# Altium schematic sheet Sensors_Board.SchDoc (part 2 of 2)
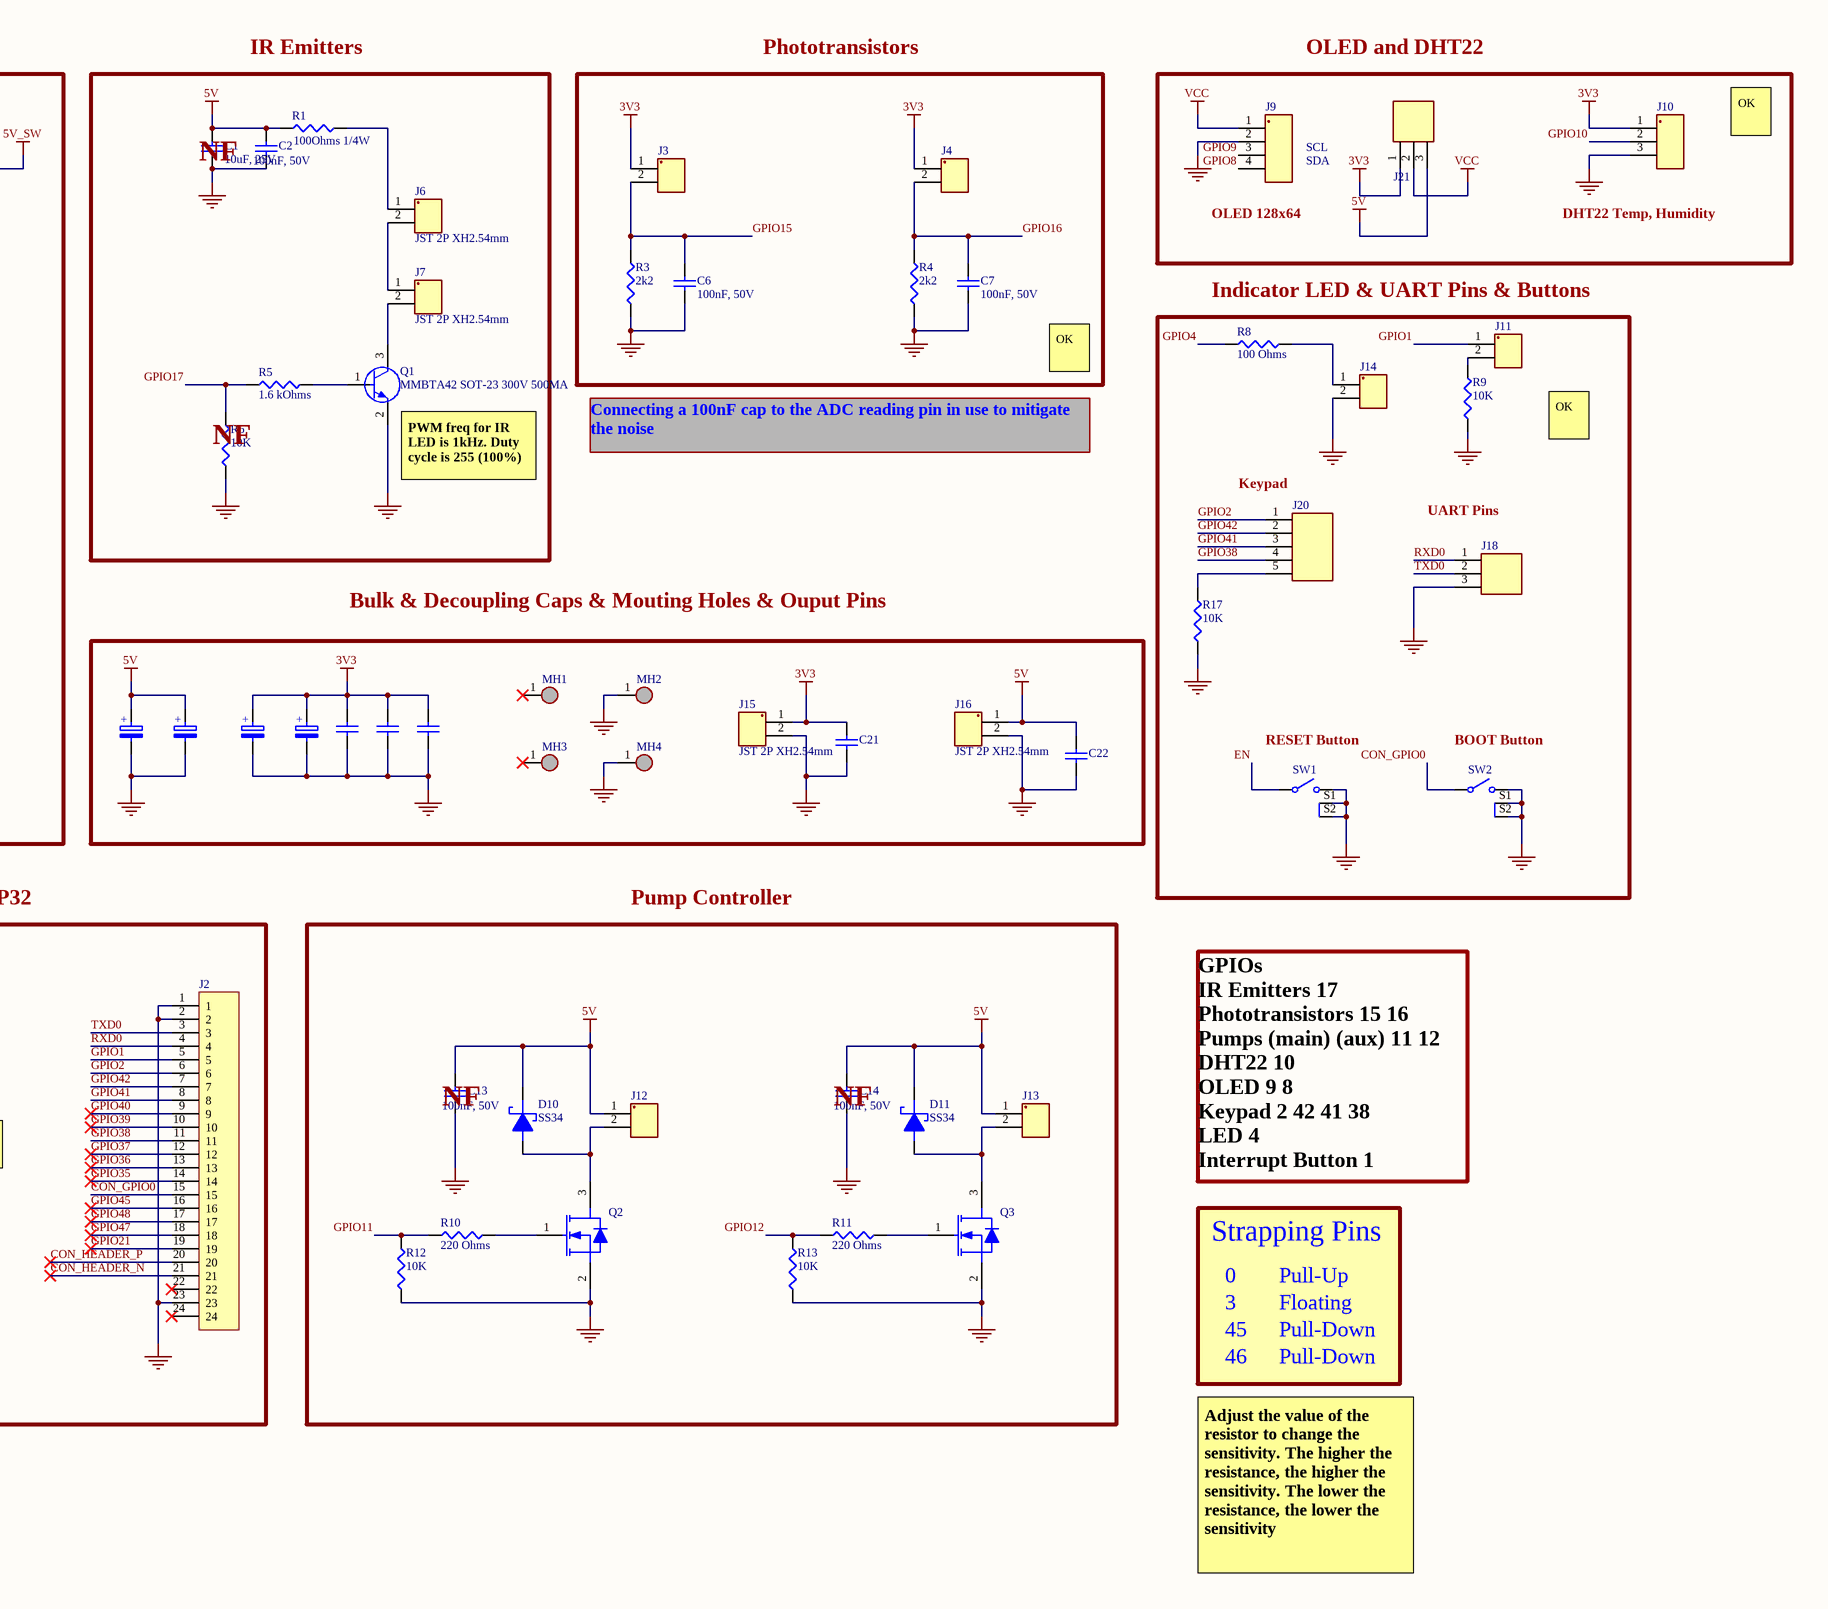
[diagram p2: Sensors_Board.SchDoc, right]

## Library data of the parts
C1 C4 C5 C9 C11 C25 = CL21B106KAYQNNE: 25V 10uF X7R ±10% 0805 Multilayer Ceramic Capacitors MLCC - SMD/SMT ROHS; Manufacturer: Samsung; Multilayer: Yes; Supplier: Digikey; Supplier Part Number: 1276-CL21B106KAYQNNECT-ND; Manufacturer Part Number: CL21B106KAYQNNE; RoHS: Yes; Category: Ceramic Capacitors; Pricing: 1=0.35, 10=0.206, 50=0.1484, 100=0.1304, 500=0.09992, 1000=0.09042 (USD); Mounting Technology: Surface Mount; Pins: 2; Dielectric Material: Ceramic; Package Shape: Rectangular; Case/Package: 0805; Min Operating Temperature: -55°C; Max Operating Temperature: 125°C; Value: 10uF; Capacitor Type: Ceramic; Tolerance  (fill in as +-): 10%; Packaging: Tape and Reel; Tolerance (fill in as +-): 10%; Rated DC Voltage (URdc): 25V; Temperature Characteristics Code: X7R; Termination: Wraparound; Reach SVHC Compliant: Yes; RoHS Compliant: No; ComponentLink1URL: https://datasheet.ciiva.com:443/pdfs/VipMasterIC/IC/SEMS/SEMS-S-A0005593215/SEMS-S-A0005590463-1.pdf?src-supplier=IHS+Markit; ComponentLink1Description: https://datasheet.ciiva.com:443/pdfs/VipMasterIC/IC/SEMS/SEMS-S-A0005593215/SEMS-S-A0005590463-1.pdf?src-supplier=IHS+Markit; LCSC Part Number: C3039694
C2 C6 C7 C10 C12-C14 C16 C18 C19 C21 C22 C26 = CL21B104KBCNNNC: 50V 100nF X7R ±10% 0805 Multilayer Ceramic Capacitors MLCC - SMD/SMT ROHS; Manufacturer: Samsung; Multilayer: Yes; Supplier: Digikey; Supplier Part Number: 1276-1003-6-ND; Manufacturer Part Number: CL21B104KBCNNNC; RoHS: Yes; Category: Ceramic Capacitors; Stock: 2034358; Pricing: 1=0.1, 10=0.035, 50=0.0238, 100=0.0203, 500=0.01446, 1000=0.01266 (USD); Mounting Technology: Surface Mount; Pins: 2; Dielectric Material: Ceramic; Package Shape: Rectangular; Case/Package: 0805; Terminal Finish: Nickel; Min Operating Temperature: -55°C; Max Operating Temperature: 125°C; JESD-609 Code: e3; Value: 100nF; Capacitor Type: Ceramic; Tolerance  (fill in as +-): 10%; Package Style: SMTMeter; Packaging: Tape and Reel; Tolerance (fill in as +-): 10%; Rated DC Voltage (URdc): 50V; Temperature Characteristics Code: X7R; Termination: Wraparound; Length: 2mm; Width: 1.25mm; Height: 0.95mm; Reach SVHC Compliant: Yes; RoHS Compliant: Yes; LCSC Part Number: C1711
C3 = CC0805KKX7RYBB103: 250V 10nF X7R ±10% 0805 Multilayer Ceramic Capacitors MLCC - SMD/SMT ROHS; Datasheet: https://www.lcsc.com/datasheet/lcsc_datasheet_2304140030_YAGEO-CC0805KKX7RYBB103_C106841.pdf; LCSC Number Part: C106841
C15 = 25SVPF100M: 100 µF 25 V Aluminum - Polymer Capacitors Radial, Can - SMD 24mOhm 5000 Hrs @ 105°C; Manufacturer: Panasonic; Dielectric Material: Aluminium; Polarity: Polarized; ESR (Equivalent Series Resistance): 24mR; Leakage Current: 500uA; Tolerance  (fill in as +-): 20%; Ripple Current: 160mA; Tan Delta: 0.12; Supplier: Digikey; Supplier Part Number: P123675DKR-ND; Manufacturer Part Number: 25SVPF100M; RoHS: Yes; Category: Polymer Capacitors; Stock: 6667; Pricing: 1=1.26, 10=0.813, 50=0.7876, 100=0.762, 500=0.608 (USD); Mounting Technology: Surface Mount; Pins: 2; Package Shape: Cylindrical; Case/Package: 3333; Min Operating Temperature: -55°C; Max Operating Temperature: 105°C; Value: 100uF; Capacitor Type: Aluminium; Tolerance (fill in as +-): 20%; Rated DC Voltage (URdc): 25V; Termination: Flat; Reach SVHC Compliant: Yes; RoHS Compliant: Yes; ComponentLink1URL: https://datasheet.ciiva.com:443/pdfs/VipMasterIC/IC/PANA/PANA-S-A0008969958/PANA-S-A0008969958-1.pdf?src-supplier=IHS+Markit; ComponentLink1Description: https://datasheet.ciiva.com:443/pdfs/VipMasterIC/IC/PANA/PANA-S-A0008969958/PANA-S-A0008969958-1.pdf?src-supplier=IHS+Markit; ComponentLink2URL: https://datasheet.ciiva.com/25746/1734360-25746518.pdf?src-supplier=Farnell; ComponentLink2Description: https://datasheet.ciiva.com/25746/1734360-25746518.pdf?src-supplier=Farnell; ComponentLink3URL: https://datasheet.ciiva.com/22746/1734360-22746213.pdf?src-supplier=Element14; ComponentLink3Description: https://datasheet.ciiva.com/22746/1734360-22746213.pdf?src-supplier=Element14; LCSC Part Number: C4747967
C20 = EEH-ZA1H100R: CAP ALUM HYBRID 10UF 20% 50V SMD (D5L6P10); Manufacturer: Panasonic; Dielectric Material: Aluminium; Polarity: Polarized; ESR (Equivalent Series Resistance): 120mR; Leakage Current: 5uA; Ripple Current: 75mA; Tan Delta: 0.1; Reference Standard: AEC-Q200; Supplier: Digikey; Supplier Part Number: 10-EEH-ZA1H100RCT-ND; Manufacturer Part Number: EEH-ZA1H100R; RoHS: Yes; Category: Polymer Capacitors; Stock: 1272; Pricing: 1=1.36, 10=0.853, 50=0.6486, 100=0.5847, 500=0.47586 (USD); Mounting Technology: Surface Mount; Pins: 2; Case/Package: 2121; Min Operating Temperature: -55°C; Max Operating Temperature: 105°C; Value: 10uF; Capacitor Type: Aluminium; Tolerance  (fill in as +-): 20%; Package Style: SMTMeter; Packaging: Tape and Reel; Tolerance (fill in as +-): 20%; Rated DC Voltage (URdc): 50V; Termination: Flat; Diameter: 5mm; Length: 5.8mm; Reach SVHC Compliant: Yes; RoHS Compliant: Yes; ComponentLink1URL: https://datasheet.ciiva.com:443/pdfs/VipMasterIC/IC/PANA/PANA-S-A0009553130/PANA-S-A0009553130-1.pdf?src-supplier=IHS+Markit; ComponentLink1Description: https://datasheet.ciiva.com:443/pdfs/VipMasterIC/IC/PANA/PANA-S-A0009553130/PANA-S-A0009553130-1.pdf?src-supplier=IHS+Markit; ComponentLink2URL: https://datasheet.ciiva.com/25613/0900766b81233638-25613634.pdf?src-supplier=Rs; ComponentLink2Description: https://datasheet.ciiva.com/25613/0900766b81233638-25613634.pdf?src-supplier=Rs; ComponentLink3URL: https://datasheet.ciiva.com/22730/1536543-22730556.pdf?src-supplier=Element14; ComponentLink3Description: https://datasheet.ciiva.com/22730/1536543-22730556.pdf?src-supplier=Element14; ComponentLink4URL: https://datasheet.ciiva.com/28691/1536543-28691417.pdf?src-supplier=Element14; ComponentLink4Description: https://datasheet.ciiva.com/28691/1536543-28691417.pdf?src-supplier=Element14; ComponentLink5URL: https://datasheet.ciiva.com/7794/1536543-7794234.pdf?src-supplier=Element14; ComponentLink5Description: https://datasheet.ciiva.com/7794/1536543-7794234.pdf?src-supplier=Element14; ComponentLink6URL: https://datasheet.ciiva.com/6121/1536543-6121368.pdf?src-supplier=Farnell; ComponentLink6Description: https://datasheet.ciiva.com/6121/1536543-6121368.pdf?src-supplier=Farnell; ComponentLink7URL: https://datasheet.ciiva.com/11679/aba0000ce136-11679434.pdf?src-supplier=Avnet; ComponentLink7Description: https://datasheet.ciiva.com/11679/aba0000ce136-11679434.pdf?src-supplier=Avnet; ComponentLink8URL: https://datasheet.ciiva.com/6327/aba0000ce136-6327913.pdf?src-supplier=Digikey; ComponentLink8Description: https://datasheet.ciiva.com/6327/aba0000ce136-6327913.pdf?src-supplier=Digikey; ComponentLink9URL: https://datasheet.ciiva.com/6327/aba0000ce136-6327914.pdf?src-supplier=Digikey; ComponentLink9Description: https://datasheet.ciiva.com/6327/aba0000ce136-6327914.pdf?src-supplier=Digikey; ComponentLink10URL: https://datasheet.ciiva.com/6327/aba0000ce136-6327916.pdf?src-supplier=Digikey; ComponentLink10Description: https://datasheet.ciiva.com/6327/aba0000ce136-6327916.pdf?src-supplier=Digikey; ComponentLink11URL: https://datasheet.ciiva.com/10331/aba0000ce136-10331175.pdf?src-supplier=Avnet; ComponentLink11Description: https://datasheet.ciiva.com/10331/aba0000ce136-10331175.pdf?src-supplier=Avnet
C23 C24 = 10SVP4R7M: 4.7 µF 10 V Aluminum - Polymer Capacitors Radial, Can - SMD 240mOhm 2000 Hrs @ 105°C; Manufacturer: Panasonic; Dielectric Material: Aluminium; Polarity: Polarized; ESR (Equivalent Series Resistance): 240mR; Leakage Current: 23.5uA; Tolerance  (fill in as +-): 20%; Rated DC Voltage (URdc): 10V; Ripple Current: 33.5mA; Tan Delta: 0.08; Supplier: Digikey; Supplier Part Number: P16437CT-ND; Manufacturer Part Number: 10SVP4R7M; RoHS: Yes; Category: Aluminum Electrolytic Capacitors; Stock: 6131; Pricing: 1=0.78, 10=0.488, 50=0.4606, 100=0.433, 500=0.363 (USD); Mounting Technology: Surface Mount; Pins: 2; Package Shape: Cylindrical; Case/Package: 1717; Min Operating Temperature: -55°C; Max Operating Temperature: 105°C; Value: 4.7uF; Capacitor Type: Aluminium; Package Style: SMTMeter; Packaging: Tape and Reel; Tolerance (fill in as +-): 20%; Termination: Flat; Length: 5mm; Width: 4.3mm; Height: 5.4mm; Reach SVHC Compliant: Yes; RoHS Compliant: Yes; ComponentLink1URL: https://datasheet.ciiva.com:443/pdfs/VipMasterIC/IC/PANA/PANA-S-A0009016943/PANA-S-A0009016943-1.pdf?src-supplier=IHS+Markit; ComponentLink1Description: https://datasheet.ciiva.com:443/pdfs/VipMasterIC/IC/PANA/PANA-S-A0009016943/PANA-S-A0009016943-1.pdf?src-supplier=IHS+Markit; ComponentLink2URL: https://datasheet.ciiva.com/25767/1734357-25767326.pdf?src-supplier=Farnell; ComponentLink2Description: https://datasheet.ciiva.com/25767/1734357-25767326.pdf?src-supplier=Farnell; ComponentLink3URL: https://datasheet.ciiva.com/24402/svp-series-datasheet-24402632.pdf?src-supplier=Onlinecomponents.com; ComponentLink3Description: https://datasheet.ciiva.com/24402/svp-series-datasheet-24402632.pdf?src-supplier=Onlinecomponents.com; LCSC Part Number: C5246584
D1 D4 D6 D10 D11 = SS34: 40V 3A 550mV SMA(DO-214AC) Schottky Diodes ROHS; LCSC Number Part: C5155170; Datasheet: https://www.lcsc.com/datasheet/lcsc_datasheet_2209161430_SUNMATE-Elec-SS34_C5155170.pdf
D2 = 150080RS75000: Red 625nm LED Indication - Discrete 2V 0805 (2012 Metric); Manufacturer: Wurth Electronics; Shape: Rectangular; Lens Style: WATER CLEAR; Forward Current: 30mA; Luminous Intensity-Nom: 150mcd; Channels: 1; Optoelectronic Device Type: SINGLE COLOR LED; Viewing Angle: 140°; Overall Height: 0.7mm; Supplier: Digikey; Supplier Part Number: 732-4984-1-ND; Manufacturer Part Number: 150080RS75000; RoHS: Yes; Category: LEDs; Stock: 52184; Pricing: 1=0.18, 50=0.176, 100=0.151, 500=0.131, 4000=0.131 (USD); Mounting Technology: Surface Mount; Pins: 2; Color: Red; Min Operating Temperature: -40°C; Max Operating Temperature: 85°C; Packaging: Tape and Reel; Size: 1.4mm; Terminal Pitch: 2.1mm; Reach SVHC Compliant: Yes; RoHS Compliant: Yes; ComponentLink1URL: https://datasheet.ciiva.com:443/pdfs/VipMasterIC/IC/MIDC/MIDC-S-A0007455974/MIDC-S-A0007455974-1.pdf?src-supplier=IHS+Markit; ComponentLink1Description: https://datasheet.ciiva.com:443/pdfs/VipMasterIC/IC/MIDC/MIDC-S-A0007455974/MIDC-S-A0007455974-1.pdf?src-supplier=IHS+Markit; ComponentLink2URL: https://datasheet.ciiva.com/22656/150080rs75000-22656961.pdf?src-supplier=Element14; ComponentLink2Description: https://datasheet.ciiva.com/22656/150080rs75000-22656961.pdf?src-supplier=Element14; ComponentLink3URL: https://datasheet.ciiva.com/29279/759435-da-01-en-chipled-0805-w-kl-rot-150080rs75000-29279032.pdf?src-supplier=Conrad; ComponentLink3Description: https://datasheet.ciiva.com/29279/759435-da-01-en-chipled-0805-w-kl-rot-150080rs75000-29279032.pdf?src-supplier=Conrad; LCSC Part Number: C7496834
D3 = SMAJ12A: TVS DIODE 12VWM 20.9VC DO214AC; Datasheet: https://www.littelfuse.com/~/media/electronics/datasheets/tvs_diodes/littelfuse_tvs_diode_smaj_datasheet.pdf.pdf; LCSC Number Part: C148213
D8 = SMAJ5A: 43.5A 400W 9.2V 6.4V 5V SMA(DO-214AC) ESD and Surge Protection (TVS/ESD) ROHS; Manufacturer: Littelfuse; Manufacturer Part Number: SMAJ5.0A; LSCS Part Number: C223992; Diode Element Material: SILICON; Package Body Material: Plastic; Polarity: Unidirectional; Diode Type: TRANS VOLTAGE SUPPRESSOR; Non-rep Peak Rev Power Dis-Max: 50kW; Number of Elements: 1; Time @ Peak Reflow Temperature-Max (s): 30s; Max Breakdown Voltage: 7V; Breakdown Voltage-Nom: 6.7V; Qualification Status: Not Qualified; Supplier: Digikey; Supplier Part Number: SMAJ5.0ALFCT-ND; RoHS: Yes; Category: TVS Diodes; Stock: 63263; Pricing: 1=0.3, 10=0.205, 100=0.1376, 500=0.1061, 1000=0.09556, 2000=0.08656, 5000=0.07665, 10000=0.07044, 15000=0.06725, 25000=0.06365, 35000=0.06151, 50000=0.05942, 125000=0.05912 (USD); Pins: 2; Package Shape: Rectangular; Terminal Finish: Tin; Min Operating Temperature: -65°C; Max Operating Temperature: 150°C; JESD-609 Code: e3; Min Breakdown Voltage: 6.4V; Clamping Voltage-Max: 9.2V; JESD-30 Code: R-PDSO-C2; Moisture Sensitivity Level: 1; Package Style: SMALL OUTLINEMeter; Peak Reflow Temperature (Cel): 260°C; Surface Mount: Yes; Technology: AVALANCHE; Terminal Form: C BEND; Terminal Position: DUAL; Rep Pk Reverse Voltage-Max: 5V; JEDEC-95 Code: DO-214AC; RoHS Compliant: Yes; Reach SVHC Compliant: No; ComponentLink1URL: https://datasheet.ciiva.com:443/pdfs/VipMasterIC/IC/LFSI/LFSI-S-A0001360630/LFSI-S-A0001360630-1.pdf?src-supplier=IHS+Markit; ComponentLink1Description: https://datasheet.ciiva.com:443/pdfs/VipMasterIC/IC/LFSI/LFSI-S-A0001360630/LFSI-S-A0001360630-1.pdf?src-supplier=IHS+Markit; ComponentLink2URL: https://datasheet.ciiva.com/25624/0900766b810f4edb-25624839.pdf?src-supplier=Rs; ComponentLink2Description: https://datasheet.ciiva.com/25624/0900766b810f4edb-25624839.pdf?src-supplier=Rs; ComponentLink3URL: https://datasheet.ciiva.com/8062/littelfuse-tvs-diode-smaj-8062271.pdf?src-supplier=Element14; ComponentLink3Description: https://datasheet.ciiva.com/8062/littelfuse-tvs-diode-smaj-8062271.pdf?src-supplier=Element14; ComponentLink4URL: https://datasheet.ciiva.com/4507/littelfuse-tvs-diode-smaj-23503-4507964.pdf?src-supplier=Mouser; ComponentLink4Description: https://datasheet.ciiva.com/4507/littelfuse-tvs-diode-smaj-23503-4507964.pdf?src-supplier=Mouser; ComponentLink5URL: https://datasheet.ciiva.com/16380/littelfuse-tvs-diode-smaj-16380982.pdf?src-supplier=Future+Electronics; ComponentLink5Description: https://datasheet.ciiva.com/16380/littelfuse-tvs-diode-smaj-16380982.pdf?src-supplier=Future+Electronics
J1 J2 = Female Header 1x24P: 24 Position Receptacle Connector 0.100" (2.54mm) Through Hole Tin
J3 J4 J6 J7 J11-J16 = JST 2P XH2.54mm: 1x2P 2P XH 1 2.54mm 2.54mm 2 -25℃~+85℃ 3A Direct Insert Plugin,P=2.5mm Wire To Board Connector ROHS; Datasheet: https://www.lcsc.com/datasheet/lcsc_datasheet_2411041827_chxunda-XD-XH-2A-G_C17700946.pdf; LCSC Number Part: C17700946
J5 J17 = Terminal Block 2P 3.5MM: 1x2P 10A -40℃~+105℃ 300V Green 16~26 Direct Insert 3.5mm 1 1 2 Plugin,P=3.5mm Screw Terminal Blocks ROHS || KF128L-3.5-2P; LCSC Part Number: C474930
J8 = DC Barrel Jack 5V: DCJ200-10-A-XX-K_REVA
J9 = JST 4P XH2.54mm: 1x4P 4P 1 XH Tin 2.54mm 2.54mm 4 -25℃~+85℃ Brass 3A Direct Insert Plugin,P=2.5mm Wire To Board Connector ROHS; LCSC Part Number: C5368777
J10 = JST 3P XH2.54mm: 1x3P 3P XH 1 2.5mm Tin 3 -25℃~+85℃ Brass 3A Direct Insert Plugin,P=2.5mm Wire To Board Connector ROHS; LCSC Part Number: C18185650
J18 = TSW-101-07-T-T: 250V 3A Direct Insert Policy 2.5mm 3P 6mm -40℃~+105℃ 3mm 2.54mm Single Row Black 1x3P Plugin,P=2.54mm Pin Headers ROHS; LCSC Part Number: C2937625
J19 = MTSW-102-08-G-S-215: Connector Header Through Hole 2 position 0.100" (2.54mm); Manufacturer: Samtec; Manufacturer Series: MTSW; Connector Type: BOARD STACKING CONNECTOR; Option: General Purpose; Filter Feature: No; Number of Rows Loaded: 1; Number of Contacts: 2; Supplier: Digikey; Supplier Part Number: 612-MTSW-102-08-G-S-215-ND; Manufacturer Part Number: MTSW-102-08-G-S-215; RoHS: Yes; Category: Connectors; Pricing: 1=0.34 (USD); Mounting Technology: Board; Contact Material: Bronze; Contact Finish - Mating: GOLD (10) OVER NICKEL; Contact Finish - Termination: GOLD (10) OVER NICKEL; JESD-609 Code: e4; Contact Gender: Male; Mixed Contacts: No; Mounting Style: STRAIGHT; Termination: Solder; Terminal Pitch: 2.54mm; DIN Conformance: No; IEC Conformance: No; MIL Conformance: No; Reach SVHC Compliant: Yes; RoHS Compliant: Yes; ComponentLink1URL: https://datasheet.ciiva.com:443/pdfs/VipMasterIC/IC/SAMI/SAMIS08368/SAMIS08368-1.pdf?src-supplier=IHS+Markit; ComponentLink1Description: https://datasheet.ciiva.com:443/pdfs/VipMasterIC/IC/SAMI/SAMIS08368/SAMIS08368-1.pdf?src-supplier=IHS+Markit; ComponentLink2URL: http://www.samtec.com/documents/webfiles/pdf/HMTSW.PDF?src-supplier=Avnet; ComponentLink2Description: http://www.samtec.com/documents/webfiles/pdf/HMTSW.PDF?src-supplier=Avnet; ComponentLink3URL: http://suddendocs.samtec.com/catalog_english/mtsw.pdf?src-supplier=Digikey; ComponentLink3Description: http://suddendocs.samtec.com/catalog_english/mtsw.pdf?src-supplier=Digikey; LCSC Part Number: C492401
J20 = HPM-05-01-T-S: 250V 3A Direct Insert Policy 2.54mm 5P 6mm -40℃~+105℃ 3mm 2.54mm Brass Black Single Row 2.54mm 1x5P Plugin,P=2.54mm Pin Headers ROHS; LCSC Part Number: C6332198
J21 = FTS-103-01-F-S: Connector Header Through Hole 3 position 0.050" (1.27mm); Manufacturer: Samtec; Manufacturer Series: FTS; Connector Type: BOARD CONNECTOR; Option: General Purpose; Additional Feature: Low Profile; Filter Feature: No; Number of Rows Loaded: 1; Number of Contacts: 3; Supplier: Digikey; Supplier Part Number: 612-FTS-103-01-F-S-ND; Manufacturer Part Number: FTS-103-01-F-S; RoHS: Yes; Category: Connectors; Stock: 2712; Pricing: 1=0.73, 50=0.6378, 100=0.5407, 500=0.4491, 1000=0.38362, 2000=0.31431, 5000=0.2478, 10000=0.2375 (USD); Mounting Technology: Board; Contact Material: Bronze; Contact Finish - Mating: GOLD (3) OVER NICKEL (50); Contact Finish - Termination: Matte Tin (Sn) - with Nickel (Ni) barrier; JESD-609 Code: e3; Contact Gender: Male; Mixed Contacts: No; Mounting Style: STRAIGHT; Termination: Solder; Terminal Pitch: 1.27mm; Flammability Rating: UL94 V-0; DIN Conformance: No; IEC Conformance: No; MIL Conformance: No; Reach SVHC Compliant: Yes; RoHS Compliant: Yes; ComponentLink1URL: https://datasheet.ciiva.com:443/pdfs/VipMasterIC/IC/SAMI/SAMI-S-A0001504673/SAMI-S-A0001504673-1.pdf?src-supplier=IHS+Markit; ComponentLink1Description: https://datasheet.ciiva.com:443/pdfs/VipMasterIC/IC/SAMI/SAMI-S-A0001504673/SAMI-S-A0001504673-1.pdf?src-supplier=IHS+Markit; ComponentLink2URL: http://suddendocs.samtec.com/prints/fts-1xx-xx-xx-xx-xx-mkt.pdf?src-supplier=Digikey; ComponentLink2Description: http://suddendocs.samtec.com/prints/fts-1xx-xx-xx-xx-xx-mkt.pdf?src-supplier=Digikey; ComponentLink3URL: http://www.samtec.com/documents/webfiles/pdf/FTS.pdf?src-supplier=Avnet; ComponentLink3Description: http://www.samtec.com/documents/webfiles/pdf/FTS.pdf?src-supplier=Avnet; ComponentLink4URL: https://datasheet.octopart.com/FTS-103-01-F-S-Samtec-datasheet-116535195.pdf?src-supplier=Toby+Electronics; ComponentLink4Description: https://datasheet.octopart.com/FTS-103-01-F-S-Samtec-datasheet-116535195.pdf?src-supplier=Toby+Electronics; ComponentLink5URL: https://datasheet.octopart.com/FTS-103-01-F-S-Samtec-datasheet-151470456.pdf?src-supplier=Sager+Electronics; ComponentLink5Description: https://datasheet.octopart.com/FTS-103-01-F-S-Samtec-datasheet-151470456.pdf?src-supplier=Sager+Electronics; LCSC Part Number: C2881648
L1 = CDRH127/LDNP-100MC: 10 µH Shielded Inductor 6.7 A 19.5mOhm Max CDRH127 (12mmx12mm); Manufacturer: Sumida; Supplier: Digikey; Supplier Part Number: 308-1330-1-ND; Manufacturer Part Number: CDRH127/LDNP-100MC; RoHS: Yes; Category: Fixed Inductors; Stock: 9075; Pricing: 1=1.32, 10=1.024, 25=0.9256, 50=0.8576, 100=0.7944, 250=0.7178, 500=0.66352, 1000=0.61423, 1500=0.58701, 2500=0.55433, 3500=0.54 (USD); Reach SVHC Compliant: No; ComponentLink1URL: https://datasheet.ciiva.com/18168/getdatasheetpartid-357344-18168730.pdf?src-supplier=Verical; ComponentLink1Description: https://datasheet.ciiva.com/18168/getdatasheetpartid-357344-18168730.pdf?src-supplier=Verical; LCSC Part Number: C2452998
MH1-MH4 = MH_7P5MMX3P2MM: 7.5mm x 3.2mm Mounting Hole
Q1 = MMBTA42: Bipolar (BJT) Transistor NPN 300 V 500 mA 50MHz 250 mW Surface Mount SOT-23-3 (TO-236); Manufacturer: Diotec; Package Body Material: Plastic; Transistor Element Material: SILICON; DC Current Gain-Min (hFE): 40; Number of Elements: 1; Power Dissipation-Max (Abs): 225mW; Qualification Status: Not Qualified; Supplier: Digikey; Supplier Part Number: 4878-MMBTA42CT-ND; Manufacturer Part Number: MMBTA42; RoHS: Yes; Category: BJTs; Stock: 1921; Pricing: 1=0.14, 10=0.097, 100=0.0647, 500=0.04922, 1000=0.04397 (USD); Pins: 3; Package Shape: Rectangular; Max Operating Temperature: 150°C; Polarity/Channel Type: NPN; Max Collector Current: 500mA; Collector-emitter Voltage-Max: 300V; JESD-30 Code: R-PDSO-G3; Package Style: SMALL OUTLINEMeter; Surface Mount: Yes; Terminal Form: Gull Wing; Terminal Position: DUAL; Frequency: 50MHz; JEDEC-95 Code: TO-236; Reach SVHC Compliant: Yes; RoHS Compliant: Yes; ComponentLink1URL: https://datasheet.ciiva.com:443/pdfs/VipMasterIC/IC/DISE/DISE-S-A0004052733/DISE-S-A0004052733-1.pdf?src-supplier=IHS+Markit; ComponentLink1Description: https://datasheet.ciiva.com:443/pdfs/VipMasterIC/IC/DISE/DISE-S-A0004052733/DISE-S-A0004052733-1.pdf?src-supplier=IHS+Markit; ComponentLink2URL: http://datasheet.octopart.com/MMBTA42-Diotec-datasheet-20771892.pdf?src-supplier=Onlinecomponents.com; ComponentLink2Description: http://datasheet.octopart.com/MMBTA42-Diotec-datasheet-20771892.pdf?src-supplier=Onlinecomponents.com; ComponentLink3URL: http://datasheet.octopart.com/MMBTA42-Diotec-datasheet-20771892.pdf?src-supplier=Mouser; ComponentLink3Description: http://datasheet.octopart.com/MMBTA42-Diotec-datasheet-20771892.pdf?src-supplier=Mouser; ComponentLink4URL: http://datasheet.octopart.com/MMBTA42-Diotec-datasheet-20771892.pdf?src-supplier=Distrelec; ComponentLink4Description: http://datasheet.octopart.com/MMBTA42-Diotec-datasheet-20771892.pdf?src-supplier=Distrelec; ComponentLink5URL: http://datasheet.octopart.com/MMBTA42-Diotec-datasheet-20771892.pdf?src-supplier=DComponents; ComponentLink5Description: http://datasheet.octopart.com/MMBTA42-Diotec-datasheet-20771892.pdf?src-supplier=DComponents; ComponentLink6URL: https://datasheet.octopart.com/MMBTA42-Diotec-datasheet-112139350.pdf?src-supplier=TME; ComponentLink6Description: https://datasheet.octopart.com/MMBTA42-Diotec-datasheet-112139350.pdf?src-supplier=TME; ComponentLink7URL: http://datasheet.octopart.com/MMBTA42-Diotec-datasheet-20771892.pdf?src-supplier=Electro+Sonic; ComponentLink7Description: http://datasheet.octopart.com/MMBTA42-Diotec-datasheet-20771892.pdf?src-supplier=Electro+Sonic; LCSC Part Number: C5185692
Q2 Q3 = LN2302LT1G: 20V 2.3A 60mΩ@4.5V,2.8A 900mW 1.2V@250uA 1 N-Channel SOT-23 MOSFETs; Datasheet: https://www.lcsc.com/datasheet/lcsc_datasheet_1811031615_LRC-LN2302LT1G_C77962.pdf; LCSC Number Part: C77962
R1 = ERJ-8GEYJ101V: RES SMD 100 OHM 5% 1/4W 1206; Manufacturer: Panasonic; Power: 250mW; Rated Temperature: 70°C; Value: 100R; Temperature Coefficient: 200ppm/°C; Working Voltage: 200V; Package Height: 0.6mm; Package Length: 3.2mm; Package Width: 1.6mm; Reference Standard: AEC-Q200; Supplier: Digikey; Supplier Part Number: P100ECT-ND; Manufacturer Part Number: ERJ-8GEYJ101V; RoHS: Yes; Category: Chip SMD Resistors; Stock: 140736; Pricing: 1=0.13, 10=0.066, 50=0.0432, 100=0.0366, 500=0.02594, 1000=0.02274, 5000=0.01742, 10000=0.0158, 15000=0.01499, 25000=0.0141, 35000=0.01358, 50000=0.01308, 125000=0.01201, 250000=0.01137, 500000=0.01084 (USD); Mounting Technology: Surface Mount; Pins: 2; Package Shape: Rectangular; Case/Package: 1206; Terminal Finish: Nickel; Min Operating Temperature: -55°C; Max Operating Temperature: 155°C; Tolerance: 5%; JESD-609 Code: e3; Resistor Type: FIXED RESISTOR; Construction: Rectangular; Packaging: Tape and Reel; Technology: METAL GLAZE/THICK FILM; Termination: Wraparound; Reach SVHC Compliant: Yes; RoHS Compliant: Yes; ComponentLink1URL: https://datasheet.ciiva.com:443/pdfs/VipMasterIC/IC/PANA/PANA-S-A0009891627/PANA-S-A0009891627-1.pdf?src-supplier=IHS+Markit; ComponentLink1Description: https://datasheet.ciiva.com:443/pdfs/VipMasterIC/IC/PANA/PANA-S-A0009891627/PANA-S-A0009891627-1.pdf?src-supplier=IHS+Markit; ComponentLink2URL: https://datasheet.ciiva.com/48531/aoa0000ce1-48531478.pdf?src-supplier=Avnet; ComponentLink2Description: https://datasheet.ciiva.com/48531/aoa0000ce1-48531478.pdf?src-supplier=Avnet; ComponentLink3URL: https://datasheet.ciiva.com/22758/1500035-22758247.pdf?src-supplier=Farnell; ComponentLink3Description: https://datasheet.ciiva.com/22758/1500035-22758247.pdf?src-supplier=Farnell; LCSC Number Part: C2904489
R2 = RC0805FR-071KL: 1 kOhms ±1% 0.125W, 1/8W Chip Resistor 0805 (2012 Metric) Moisture Resistant Thick Film; Manufacturer: Yageo; Additional Feature: LASER TRIMMABLE; Power: 125mW; Rated Temperature: 70°C; Value: 1kR; Temperature Coefficient: 100ppm/°C; Working Voltage: 150V; Package Height: 0.5mm; Package Length: 2mm; Package Width: 1.25mm; Supplier: Digikey; Supplier Part Number: 311-1.00KCRCT-ND; Manufacturer Part Number: RC0805FR-071KL; RoHS: Yes; Category: Chip SMD Resistors; Stock: 1656654; Pricing: 1=0.1, 10=0.016, 50=0.0132, 500=0.00868, 1000=0.00714, 5000=0.00408, 10000=0.00306 (USD); Mounting Technology: Surface Mount; Pins: 2; Package Shape: Rectangular; Case/Package: 0805; Terminal Finish: Nickel; Min Operating Temperature: -55°C; Max Operating Temperature: 155°C; Tolerance: 1%; JESD-609 Code: e3; Resistor Type: FIXED RESISTOR; Construction: Chip; Package Style: SMTMeter; Packaging: Tape and Reel; Technology: METAL GLAZE/THICK FILM; Termination: Wraparound; Reach SVHC Compliant: Yes; RoHS Compliant: Yes; ComponentLink1URL: https://datasheet.ciiva.com:443/pdfs/VipMasterIC/IC/YAGO/YAGO-S-A0008145938/YAGO-S-A0008145938-1.pdf?src-supplier=IHS+Markit; ComponentLink1Description: https://datasheet.ciiva.com:443/pdfs/VipMasterIC/IC/YAGO/YAGO-S-A0008145938/YAGO-S-A0008145938-1.pdf?src-supplier=IHS+Markit; LCSC Part Number: C95781
R3 R4 = RC0805FR-0722KL: 2.2 kOhms ±1% 0.125W, 1/8W Chip Resistor 0805 (2012 Metric) Moisture Resistant Thick Film; Manufacturer: Yageo; Additional Feature: LASER TRIMMABLE; Power: 125mW; Rated Temperature: 70°C; Value: 22kR; Temperature Coefficient: 100ppm/°C; Working Voltage: 150V; Package Height: 0.5mm; Package Length: 2mm; Package Width: 1.25mm; Supplier: Digikey; Supplier Part Number: 311-22.0KCRCT-ND; Manufacturer Part Number: RC0805FR-0722KL; RoHS: Yes; Category: Chip SMD Resistors; Stock: 277168; Pricing: 1=0.1, 10=0.016, 50=0.0132, 100=0.0087, 500=0.00714 (USD); Mounting Technology: Surface Mount; Pins: 2; Package Shape: Rectangular; Case/Package: 0805; Terminal Finish: Nickel; Min Operating Temperature: -55°C; Max Operating Temperature: 155°C; Tolerance: 1%; JESD-609 Code: e3; Resistor Type: FIXED RESISTOR; Construction: Chip; Packaging: Tape and Reel; Technology: METAL GLAZE/THICK FILM; Termination: Wraparound; Reach SVHC Compliant: Yes; RoHS Compliant: Yes; ComponentLink1URL: https://datasheet.ciiva.com:443/pdfs/VipMasterIC/IC/YAGO/YAGO-S-A0008145938/YAGO-S-A0008145938-1.pdf?src-supplier=IHS+Markit; ComponentLink1Description: https://datasheet.ciiva.com:443/pdfs/VipMasterIC/IC/YAGO/YAGO-S-A0008145938/YAGO-S-A0008145938-1.pdf?src-supplier=IHS+Markit; ComponentLink2URL: https://datasheet.ciiva.com/2457/pyu-r-int-thick-7-2457032.pdf?src-supplier=Digikey; ComponentLink2Description: https://datasheet.ciiva.com/2457/pyu-r-int-thick-7-2457032.pdf?src-supplier=Digikey; ComponentLink3URL: https://datasheet.ciiva.com/2457/pyu-r-int-thick-7-2457033.pdf?src-supplier=Digikey; ComponentLink3Description: https://datasheet.ciiva.com/2457/pyu-r-int-thick-7-2457033.pdf?src-supplier=Digikey; ComponentLink4URL: https://datasheet.ciiva.com/2457/pyu-r-int-thick-7-2457034.pdf?src-supplier=Digikey; ComponentLink4Description: https://datasheet.ciiva.com/2457/pyu-r-int-thick-7-2457034.pdf?src-supplier=Digikey; ComponentLink5URL: https://datasheet.ciiva.com/12577/rc0805-12577717.pdf?src-supplier=Mouser; ComponentLink5Description: https://datasheet.ciiva.com/12577/rc0805-12577717.pdf?src-supplier=Mouser; ComponentLink6URL: https://datasheet.ciiva.com/7941/444164-7941742.pdf?src-supplier=Element14; ComponentLink6Description: https://datasheet.ciiva.com/7941/444164-7941742.pdf?src-supplier=Element14; ComponentLink7URL: https://datasheet.ciiva.com/7941/444164-7941743.pdf?src-supplier=Element14; ComponentLink7Description: https://datasheet.ciiva.com/7941/444164-7941743.pdf?src-supplier=Element14; ComponentLink8URL: https://datasheet.ciiva.com/46447/444164-46447573.pdf?src-supplier=Element14; ComponentLink8Description: https://datasheet.ciiva.com/46447/444164-46447573.pdf?src-supplier=Element14; LCSC Number Part: C114561
R5 = RC0805FR-071K6L: 1.6 kOhms ±1% 0.125W, 1/8W Chip Resistor 0805 (2012 Metric) Moisture Resistant Thick Film; Manufacturer: Yageo; Additional Feature: LASER TRIMMABLE; Power: 125mW; Rated Temperature: 70°C; Value: 1.6kR; Temperature Coefficient: 100ppm/°C; Working Voltage: 150V; Package Height: 0.5mm; Package Length: 2mm; Package Width: 1.25mm; Supplier: Digikey; Supplier Part Number: 311-1.60KCRCT-ND; Manufacturer Part Number: RC0805FR-071K6L; RoHS: Yes; Category: Chip SMD Resistors; Stock: 82626; Pricing: 1=0.1, 10=0.016, 50=0.0132, 100=0.0102, 500=0.00868, 1000=0.00781 (USD); Mounting Technology: Surface Mount; Pins: 2; Package Shape: Rectangular; Case/Package: 0805; Terminal Finish: Nickel; Min Operating Temperature: -55°C; Max Operating Temperature: 155°C; Tolerance: 1%; JESD-609 Code: e3; Resistor Type: FIXED RESISTOR; Construction: Chip; Packaging: Tape and Reel; Technology: METAL GLAZE/THICK FILM; Termination: Wraparound; Reach SVHC Compliant: Yes; RoHS Compliant: Yes; ComponentLink1URL: https://datasheet.ciiva.com:443/pdfs/VipMasterIC/IC/YAGO/YAGO-S-A0008145938/YAGO-S-A0008145938-1.pdf?src-supplier=IHS+Markit; ComponentLink1Description: https://datasheet.ciiva.com:443/pdfs/VipMasterIC/IC/YAGO/YAGO-S-A0008145938/YAGO-S-A0008145938-1.pdf?src-supplier=IHS+Markit; ComponentLink2URL: https://datasheet.ciiva.com/11808/0900766b8106beab-11808593.pdf?src-supplier=Rs; ComponentLink2Description: https://datasheet.ciiva.com/11808/0900766b8106beab-11808593.pdf?src-supplier=Rs; LCSC Number Part: C104016
R6 R7 R9 R12 R13 R17 = RC0805JR-0710KL: 125mW Thick Film Resistors 150V ±100ppm/℃ ±5% 10kΩ 0805 Chip Resistor - Surface Mount ROHS; Manufacturer: Yageo; Additional Feature: LASER TRIMMABLE; Rated Temperature: 70°C; Value: 10kR; Temperature Coefficient: 100ppm/°C; Package Height: 0.5mm; Package Length: 2mm; Package Width: 1.25mm; Supplier: Digikey; Supplier Part Number: 311-10KARCT-ND; Manufacturer Part Number: RC0805JR-0710KL; RoHS: Yes; Category: Chip SMD Resistors; Stock: 306810; Pricing: 1=0.1, 10=0.015, 50=0.0122, 100=0.0092, 500=0.00764, 1000=0.00612, 5000=0.00306, 10000=0.00291, 15000=0.00274 (USD); Mounting Technology: Surface Mount; Pins: 2; Package Shape: Rectangular; Case/Package: 0805; Terminal Finish: Nickel; Min Operating Temperature: -55°C; Max Operating Temperature: 155°C; Tolerance: 5%; JESD-609 Code: e3; Resistor Type: FIXED RESISTOR; Construction: Chip; Package Style: SMTMeter; Packaging: Tape and Reel; Power: 125mW; Technology: METAL GLAZE/THICK FILM; Termination: Wraparound; Working Voltage: 150V; Reach SVHC Compliant: Yes; RoHS Compliant: Yes; ComponentLink1URL: https://datasheet.ciiva.com:443/pdfs/VipMasterIC/IC/YAGO/YAGO-S-A0008145938/YAGO-S-A0008145938-1.pdf?src-supplier=IHS+Markit; ComponentLink1Description: https://datasheet.ciiva.com:443/pdfs/VipMasterIC/IC/YAGO/YAGO-S-A0008145938/YAGO-S-A0008145938-1.pdf?src-supplier=IHS+Markit; ComponentLink2URL: https://datasheet.ciiva.com/7983/444164-7983765.pdf?src-supplier=Element14; ComponentLink2Description: https://datasheet.ciiva.com/7983/444164-7983765.pdf?src-supplier=Element14; ComponentLink3URL: https://datasheet.ciiva.com/7941/444164-7941870.pdf?src-supplier=Element14; ComponentLink3Description: https://datasheet.ciiva.com/7941/444164-7941870.pdf?src-supplier=Element14; ComponentLink4URL: https://datasheet.ciiva.com/7941/444164-7941871.pdf?src-supplier=Element14; ComponentLink4Description: https://datasheet.ciiva.com/7941/444164-7941871.pdf?src-supplier=Element14; LCSC Part Number: C100047
R8 = RC0805FR-07100RL: RES 100 OHM 1% 1/8W 0805; Manufacturer: Yageo; Additional Feature: LASER TRIMMABLE; Power: 125mW; Rated Temperature: 70°C; Value: 100R; Temperature Coefficient: 100ppm/°C; Working Voltage: 150V; Package Height: 0.5mm; Package Length: 2mm; Package Width: 1.25mm; Supplier: Digikey; Supplier Part Number: 311-100CRCT-ND; Manufacturer Part Number: RC0805FR-07100RL; RoHS: Yes; Category: Chip SMD Resistors; Stock: 1132709; Pricing: 1=0.1, 10=0.017, 50=0.0158, 100=0.0143, 500=0.0102, 1000=0.00816, 5000=0.0051, 10000=0.00408 (USD); Mounting Technology: Surface Mount; Pins: 2; Package Shape: Rectangular; Case/Package: 0805; Terminal Finish: Nickel; Min Operating Temperature: -55°C; Max Operating Temperature: 155°C; Tolerance: 1%; JESD-609 Code: e3; Resistor Type: FIXED RESISTOR; Construction: Chip; Packaging: Tape and Reel; Technology: METAL GLAZE/THICK FILM; Termination: Wraparound; Reach SVHC Compliant: Yes; RoHS Compliant: Yes; ComponentLink1URL: https://datasheet.ciiva.com:443/pdfs/VipMasterIC/IC/YAGO/YAGO-S-A0008145938/YAGO-S-A0008145938-1.pdf?src-supplier=IHS+Markit; ComponentLink1Description: https://datasheet.ciiva.com:443/pdfs/VipMasterIC/IC/YAGO/YAGO-S-A0008145938/YAGO-S-A0008145938-1.pdf?src-supplier=IHS+Markit; ComponentLink2URL: https://datasheet.ciiva.com/11808/0900766b8106beab-11808877.pdf?src-supplier=Rs; ComponentLink2Description: https://datasheet.ciiva.com/11808/0900766b8106beab-11808877.pdf?src-supplier=Rs; ComponentLink3URL: https://datasheet.ciiva.com/7941/1697719-7941680.pdf?src-supplier=Element14; ComponentLink3Description: https://datasheet.ciiva.com/7941/1697719-7941680.pdf?src-supplier=Element14; ComponentLink4URL: https://datasheet.ciiva.com/7941/1686128-7941679.pdf?src-supplier=Element14; ComponentLink4Description: https://datasheet.ciiva.com/7941/1686128-7941679.pdf?src-supplier=Element14; ComponentLink5URL: https://datasheet.ciiva.com/46447/444164-46447562.pdf?src-supplier=Element14; ComponentLink5Description: https://datasheet.ciiva.com/46447/444164-46447562.pdf?src-supplier=Element14; ComponentLink6URL: https://datasheet.ciiva.com/2456/pyu-r-int-thick-7-2456989.pdf?src-supplier=Digikey; ComponentLink6Description: https://datasheet.ciiva.com/2456/pyu-r-int-thick-7-2456989.pdf?src-supplier=Digikey; ComponentLink7URL: https://datasheet.ciiva.com/2456/pyu-r-int-thick-7-2456987.pdf?src-supplier=Digikey; ComponentLink7Description: https://datasheet.ciiva.com/2456/pyu-r-int-thick-7-2456987.pdf?src-supplier=Digikey; ComponentLink8URL: https://datasheet.ciiva.com/17082/rc0805-17082697.pdf?src-supplier=Future+Electronics; ComponentLink8Description: https://datasheet.ciiva.com/17082/rc0805-17082697.pdf?src-supplier=Future+Electronics; ComponentLink9URL: https://datasheet.ciiva.com/7660/38627-7660797.pdf?src-supplier=Element14; ComponentLink9Description: https://datasheet.ciiva.com/7660/38627-7660797.pdf?src-supplier=Element14; ComponentLink10URL: https://datasheet.ciiva.com/22747/444164-22747535.pdf?src-supplier=Element14; ComponentLink10Description: https://datasheet.ciiva.com/22747/444164-22747535.pdf?src-supplier=Element14; ComponentLink11URL: https://datasheet.ciiva.com/2456/pyu-r-int-thick-7-2456988.pdf?src-supplier=Digikey; ComponentLink11Description: https://datasheet.ciiva.com/2456/pyu-r-int-thick-7-2456988.pdf?src-supplier=Digikey; LCSC Part Number: C327455
R10 R11 = CRGCQ0805F220R: RES 220 OHM 1% 1/8W 0805; Manufacturer: TE Connectivity; Supplier: Digikey; Supplier Part Number: A129741CT-ND; Manufacturer Part Number: CRGCQ0805F220R; RoHS: Yes; Category: Chip SMD Resistors; Stock: 1167728; Pricing: 1=0.1, 10=0.033, 50=0.0206, 100=0.0171, 500=0.01168, 1000=0.01008 (USD); Pins: 2; Resistor Type: FIXED RESISTOR; Reach SVHC Compliant: Yes; RoHS Compliant: Yes; ComponentLink1URL: https://datasheet.ciiva.com:443/pdfs/VipMasterIC/IC/TYEL/TYEL-S-A0004929575/TYEL-S-A0004929575-1.pdf?src-supplier=IHS+Markit; ComponentLink1Description: https://datasheet.ciiva.com:443/pdfs/VipMasterIC/IC/TYEL/TYEL-S-A0004929575/TYEL-S-A0004929575-1.pdf?src-supplier=IHS+Markit; ComponentLink2URL: https://www.te.com/commerce/DocumentDelivery/DDEController?Action=srchrtrv&amp;DocNm=1773204-3&amp;DocType=DS&amp;DocLang=English&src-supplier=Digikey; ComponentLink2Description: https://www.te.com/commerce/DocumentDelivery/DDEController?Action=srchrtrv&amp;DocNm=1773204-3&amp;DocType=DS&amp;DocLang=English&src-supplier=Digikey; ComponentLink3URL: https://4donline.ihs.com/images/VipMasterIC/IC/TYEL/TYEL-S-A0004929575/TYEL-S-A0004929575-1.pdf?hkey=52A5661711E402568146F3353EA87419&src-supplier=Farnell; ComponentLink3Description: https://4donline.ihs.com/images/VipMasterIC/IC/TYEL/TYEL-S-A0004929575/TYEL-S-A0004929575-1.pdf?hkey=52A5661711E402568146F3353EA87419&src-supplier=Farnell; ComponentLink4URL: https://4donline.ihs.com/images/VipMasterIC/IC/TYEL/TYEL-S-A0004929575/TYEL-S-A0004929575-1.pdf?hkey=52A5661711E402568146F3353EA87419&src-supplier=Newark; ComponentLink4Description: https://4donline.ihs.com/images/VipMasterIC/IC/TYEL/TYEL-S-A0004929575/TYEL-S-A0004929575-1.pdf?hkey=52A5661711E402568146F3353EA87419&src-supplier=Newark; ComponentLink5URL: https://datasheet.octopart.com/CRGCQ0805F220R-TE-Connectivity-datasheet-114679081.pdf?src-supplier=Master+Electronics; ComponentLink5Description: https://datasheet.octopart.com/CRGCQ0805F220R-TE-Connectivity-datasheet-114679081.pdf?src-supplier=Master+Electronics; LCSC Part Number: C374734
R14 R15 = TAJC227K006RNJ: Tantalum Capacitor, Polarized, Tantalum (dry/solid), 6.3V, 10% +Tol, 10% -Tol, 220uF, Surface Mount, 2312; Manufacturer: Kyocera AVX; ESR (Equivalent Series Resistance): 1.2R; Leakage Current: 13.9uA; Tan Delta: 0.08; Reference Standard: CECC30801-005; Supplier: Digikey; Supplier Part Number: 478-1713-1-ND; Manufacturer Part Number: TAJC227K006RNJ; RoHS: Yes; Category: Tantalum Capacitors; Stock: 3416; Pricing: 1=0.91, 10=0.555, 50=0.4142, 100=0.3705, 500=0.29584, 1000=0.27254, 1500=0.26081, 2500=0.24777, 3500=0.24011, 5000=0.23273, 12500=0.21674, 25000=0.20703, 50000=0.19899 (USD); Mounting Technology: Surface Mount; Pins: 2; Dielectric Material: Tantalum; Package Shape: Rectangular; Case/Package: 2312; Terminal Finish: Nickel; Min Operating Temperature: -55°C; Max Operating Temperature: 125°C; JESD-609 Code: e3; Polarity: Polarized; Value: 220uF; Capacitor Type: Tantalum; Tolerance  (fill in as +-): 10%; Package Style: SMTMeter; Packaging: Tape and Reel; Tolerance (fill in as +-): 10%; Rated DC Voltage (URdc): 6.3V; Termination: J BEND; Length: 6mm; Width: 3.2mm; Height: 2.6mm; Reach SVHC Compliant: Yes; RoHS Compliant: Yes; ComponentLink1URL: https://datasheet.ciiva.com:443/pdfs/VipMasterIC/IC/AVXC/AVXC-S-A0008794508/AVXC-S-A0008794508-1.pdf?src-supplier=IHS+Markit; ComponentLink1Description: https://datasheet.ciiva.com:443/pdfs/VipMasterIC/IC/AVXC/AVXC-S-A0008794508/AVXC-S-A0008794508-1.pdf?src-supplier=IHS+Markit; ComponentLink2URL: https://datasheet.ciiva.com/11793/0900766b80ccdc61-11793155.pdf?src-supplier=Rs; ComponentLink2Description: https://datasheet.ciiva.com/11793/0900766b80ccdc61-11793155.pdf?src-supplier=Rs; ComponentLink3URL: https://datasheet.ciiva.com/26341/559452-da-01-en-tacc-c-6-0-mm-x-3-2-mm-x-2-6-mm-220-uf-26341792.pdf?src-supplier=Conrad; ComponentLink3Description: https://datasheet.ciiva.com/26341/559452-da-01-en-tacc-c-6-0-mm-x-3-2-mm-x-2-6-mm-220-uf-26341792.pdf?src-supplier=Conrad; ComponentLink4URL: https://datasheet.ciiva.com/18710/taj-eng-18710873.pdf?src-supplier=Distrelec; ComponentLink4Description: https://datasheet.ciiva.com/18710/taj-eng-18710873.pdf?src-supplier=Distrelec; ComponentLink5URL: https://datasheet.ciiva.com/7773/1680476-7773710.pdf?src-supplier=Element14; ComponentLink5Description: https://datasheet.ciiva.com/7773/1680476-7773710.pdf?src-supplier=Element14; ComponentLink6URL: https://datasheet.ciiva.com/7773/1680476-7773711.pdf?src-supplier=Element14; ComponentLink6Description: https://datasheet.ciiva.com/7773/1680476-7773711.pdf?src-supplier=Element14; ComponentLink7URL: https://datasheet.ciiva.com/5935/13070-5935479.pdf?src-supplier=Farnell; ComponentLink7Description: https://datasheet.ciiva.com/5935/13070-5935479.pdf?src-supplier=Farnell; ComponentLink8URL: https://datasheet.ciiva.com/264/taj-264613.pdf?src-supplier=Digikey; ComponentLink8Description: https://datasheet.ciiva.com/264/taj-264613.pdf?src-supplier=Digikey; ComponentLink9URL: https://datasheet.ciiva.com/264/taj-264612.pdf?src-supplier=Digikey; ComponentLink9Description: https://datasheet.ciiva.com/264/taj-264612.pdf?src-supplier=Digikey; ComponentLink10URL: https://datasheet.ciiva.com/264/taj-264614.pdf?src-supplier=Digikey; ComponentLink10Description: https://datasheet.ciiva.com/264/taj-264614.pdf?src-supplier=Digikey; ComponentLink11URL: https://datasheet.ciiva.com/12883/taj-27497-12883273.pdf?src-supplier=Mouser; ComponentLink11Description: https://datasheet.ciiva.com/12883/taj-27497-12883273.pdf?src-supplier=Mouser; ComponentLink12URL: https://datasheet.ciiva.com/14600/70001050-14600889.pdf?src-supplier=Allied+Electronics; ComponentLink12Description: https://datasheet.ciiva.com/14600/70001050-14600889.pdf?src-supplier=Allied+Electronics; ComponentLink13URL: https://datasheet.ciiva.com/14599/70001050-14599311.pdf?src-supplier=Allied+Electronics; ComponentLink13Description: https://datasheet.ciiva.com/14599/70001050-14599311.pdf?src-supplier=Allied+Electronics; ComponentLink14URL: https://datasheet.ciiva.com/16492/taj-16492906.pdf?src-supplier=Future+Electronics; ComponentLink14Description: https://datasheet.ciiva.com/16492/taj-16492906.pdf?src-supplier=Future+Electronics; LCSC Part Number: *
R16 = RC0805FR-073K3L: 125mW ±1% 3.3kΩ 0805 Chip Resistor - Surface Mount ROHS; Manufacturer: Yageo; Additional Feature: LASER TRIMMABLE; Rated Temperature: 70°C; Value: 3.3kR; Working Voltage: 150V; Temperature Coefficient (ppm/Cel): 100; Package Height: 0.5mm; Package Length: 2mm; Package Width: 1.25mm; Supplier: Digikey; Supplier Part Number: 311-3.30KCRCT-ND; Manufacturer Part Number: RC0805FR-073K3L; RoHS: Yes; Category: Chip SMD Resistors; Stock: 1112941; Pricing: 1=0.1, 10=0.016, 50=0.0132, 100=0.0102, 500=0.00868, 1000=0.00781 (USD); Mounting Technology: Surface Mount; Pins: 2; Package Shape: Rectangular; Case/Package: 0805; Terminal Finish: Nickel; Min Operating Temperature: -55°C; Max Operating Temperature: 155°C; Tolerance: 1%; JESD-609 Code: e3; Resistor Type: FIXED RESISTOR; Construction: Chip; Packaging: Tape and Reel; Power: 125mW; Technology: METAL GLAZE/THICK FILM; Termination: Wraparound; Reach SVHC Compliant: Yes; RoHS Compliant: Yes; ComponentLink1URL: https://datasheet.ciiva.com:443/pdfs/VipMasterIC/IC/YAGO/YAGO-S-A0008145938/YAGO-S-A0008145938-1.pdf?src-supplier=IHS+Markit; ComponentLink1Description: https://datasheet.ciiva.com:443/pdfs/VipMasterIC/IC/YAGO/YAGO-S-A0008145938/YAGO-S-A0008145938-1.pdf?src-supplier=IHS+Markit; LCSC Part Number: C269541
SW1 SW2 = Tactile Button Right Angle: Tactile Switch SPST-NO Side Actuated Through Hole, Right Angle
U1 = TPS5430DDAR: Step-down type Adjustable 1.221V~32.04V 3A 5.5V~36V SOIC-8-EP DC-DC Converters ROHS; Manufacturer: Texas Instruments; Package Body Material: Plastic; Throw Configuration: SWITCHING REGULATOR; Control Mode: VOLTAGE-MODE; Control Technique: PULSE WIDTH MODULATION; Max Supply Voltage: 36V; Min Input Voltage: 5.5V; Nominal Supply Voltage: 12V; Channels: 1; Max Output current: 6A; Package Equivalence Code: SOP8,.25; Switcher Configuration: BUCK; Frequency: 600kHz; Qualification Status: Not Qualified; Supplier: Digikey; Supplier Part Number: 296-26988-1-ND; Manufacturer Part Number: TPS5430DDAR; RoHS: Yes; Category: Voltage Regulators - Switching; Stock: 3440; Pricing: 1=4, 10=3.024, 25=2.78, 100=2.5118, 250=2.38388, 500=2.30678, 1000=2.24331, 2500=2.1763 (USD); Case/Package: HLSOP; Pins: 8; Package Shape: Rectangular; Terminal Finish: Nickel; Min Operating Temperature: -40°C; Max Operating Temperature: 125°C; JESD-609 Code: e4; JESD-30 Code: R-PDSO-G8; Moisture Sensitivity Level: 1; Package Style: SMALL OUTLINE, HEAT SINK/SLUG, LOW PROFILEMeter; Peak Reflow Temperature (Cel): 260°C; Surface Mount: Yes; Technology: MOS; Terminal Form: Gull Wing; Terminal Position: DUAL; Length: 4.89mm; Width: 3.9mm; Height - Seated (Max): 1.68mm; Terminal Pitch: 1.27mm; Temperature Grade: AUTOMOTIVE; Reach SVHC Compliant: Yes; RoHS Compliant: Yes; ComponentLink1URL: https://www.ti.com:443/lit/ds/symlink/tps5430.pdf?src-supplier=IHS+Markit; ComponentLink1Description: https://www.ti.com:443/lit/ds/symlink/tps5430.pdf?src-supplier=IHS+Markit; ComponentLink2URL: https://datasheet.ciiva.com/27052/1523997-27052321.pdf?src-supplier=Jameco; ComponentLink2Description: https://datasheet.ciiva.com/27052/1523997-27052321.pdf?src-supplier=Jameco; ComponentLink3URL: https://datasheet.ciiva.com/15113/getdatasheetpartid-214658-15113401.pdf?src-supplier=Verical; ComponentLink3Description: https://datasheet.ciiva.com/15113/getdatasheetpartid-214658-15113401.pdf?src-supplier=Verical; ComponentLink4URL: https://datasheet.ciiva.com/41462/001014839-da-01-en-ic-reg-buck-adj-3-tps5430ddar-soic-8-tid-41462684.pdf?src-supplier=Conrad; ComponentLink4Description: https://datasheet.ciiva.com/41462/001014839-da-01-en-ic-reg-buck-adj-3-tps5430ddar-soic-8-tid-41462684.pdf?src-supplier=Conrad; ComponentLink5URL: https://datasheet.ciiva.com/2035/tps5431-2035207.pdf?src-supplier=Digikey; ComponentLink5Description: https://datasheet.ciiva.com/2035/tps5431-2035207.pdf?src-supplier=Digikey; ComponentLink6URL: https://datasheet.ciiva.com/2035/tps5431-2035206.pdf?src-supplier=Digikey; ComponentLink6Description: https://datasheet.ciiva.com/2035/tps5431-2035206.pdf?src-supplier=Digikey; ComponentLink7URL: https://datasheet.ciiva.com/2035/tps5431-2035208.pdf?src-supplier=Digikey; ComponentLink7Description: https://datasheet.ciiva.com/2035/tps5431-2035208.pdf?src-supplier=Digikey; LCSC Part Number: C9864
U2 = LM1117MP-3.3/NOPB: IC REG LINEAR 3.3V 800MA SOT223; Manufacturer: TI National Semiconductor; Supplier: Digikey; Supplier Part Number: LM1117MP-3.3/NOPBCT-ND; Manufacturer Part Number: LM1117MP-3.3/NOPB; RoHS: Yes; Category: Voltage Regulators - Linear; Stock: 63878; Pricing: 1=1.38, 10=1.007, 25=0.9128, 100=0.8093, 250=0.75996, 500=0.73016 (USD); LCSC Part Number: C411821